# Altium project RheoBoard_v2.PrjPcb (part 1 of 5)
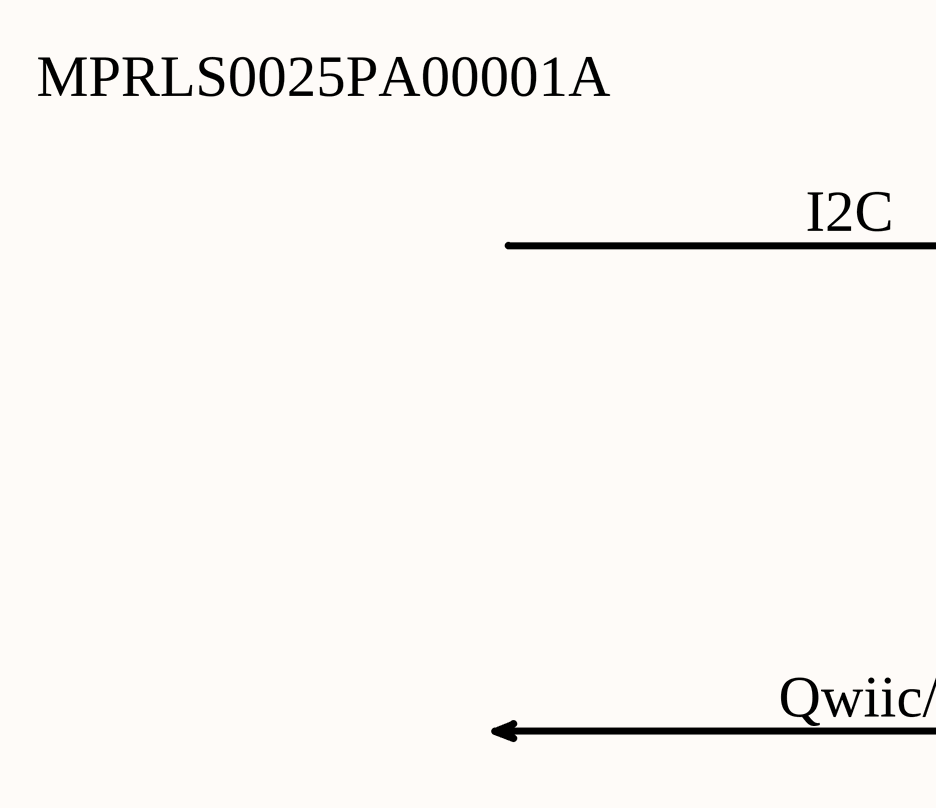
[diagram p0: RheoBoard_v2.SchDoc, top left]
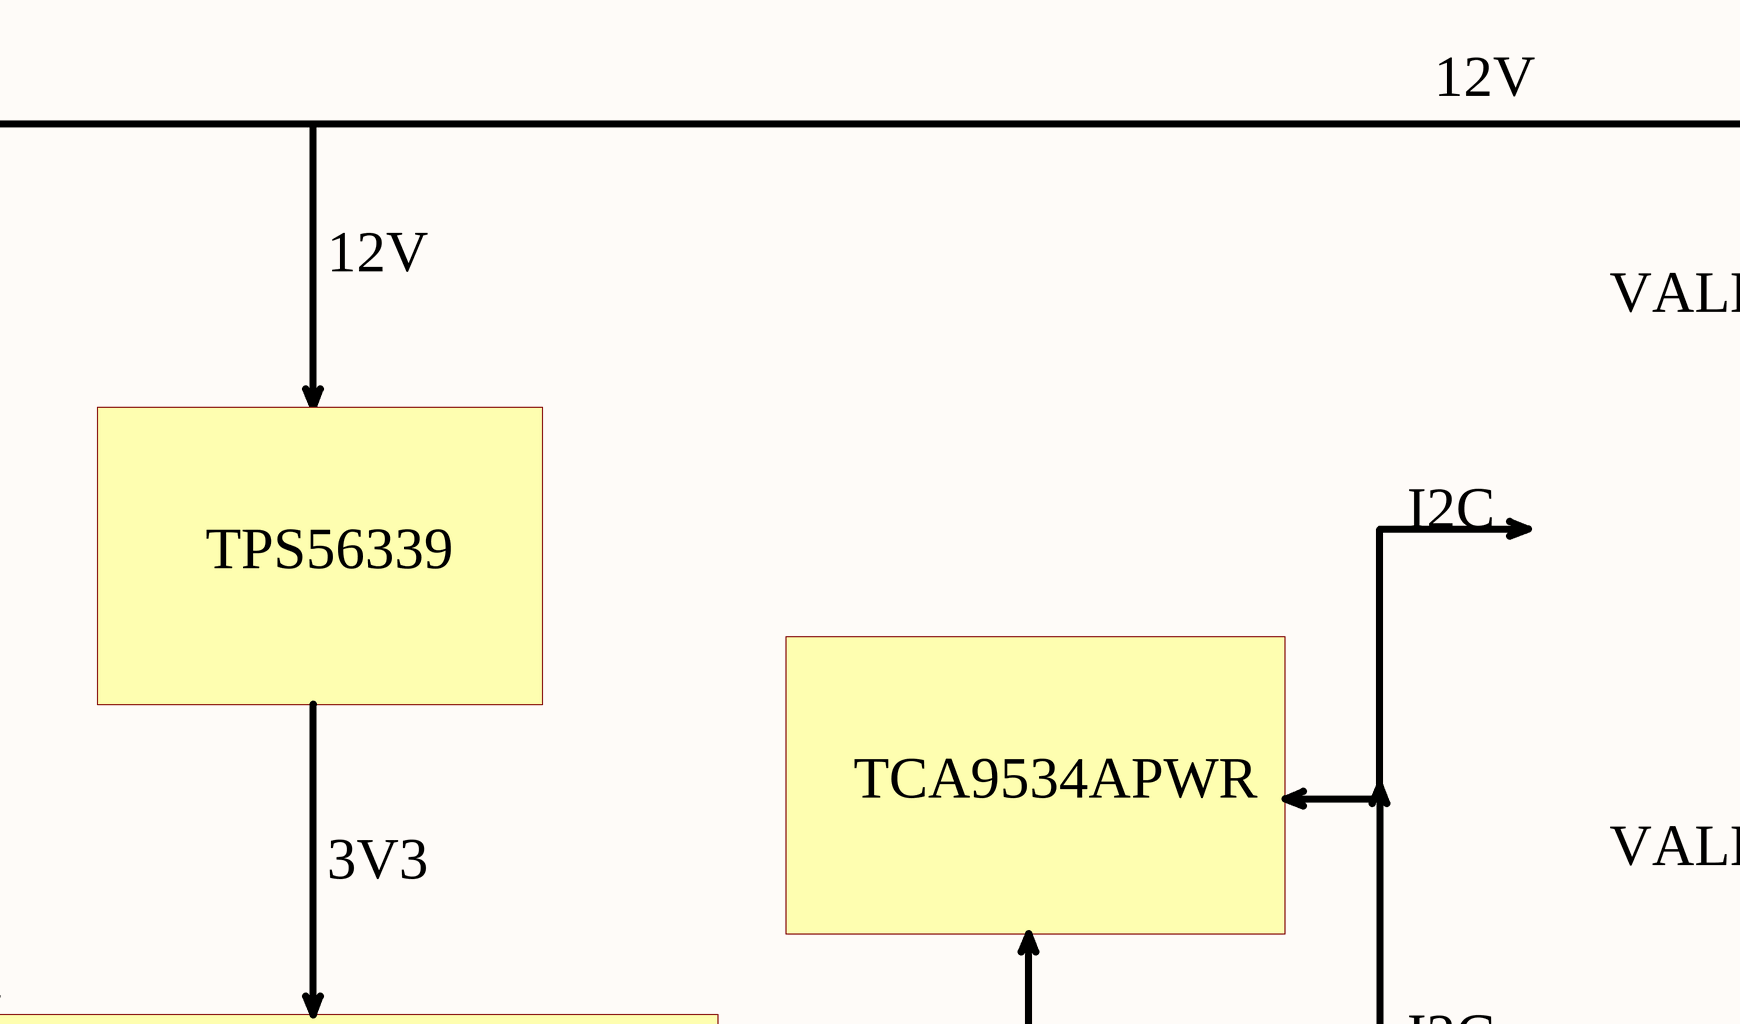
[diagram p1: RheoBoard_v2.SchDoc, top middle]
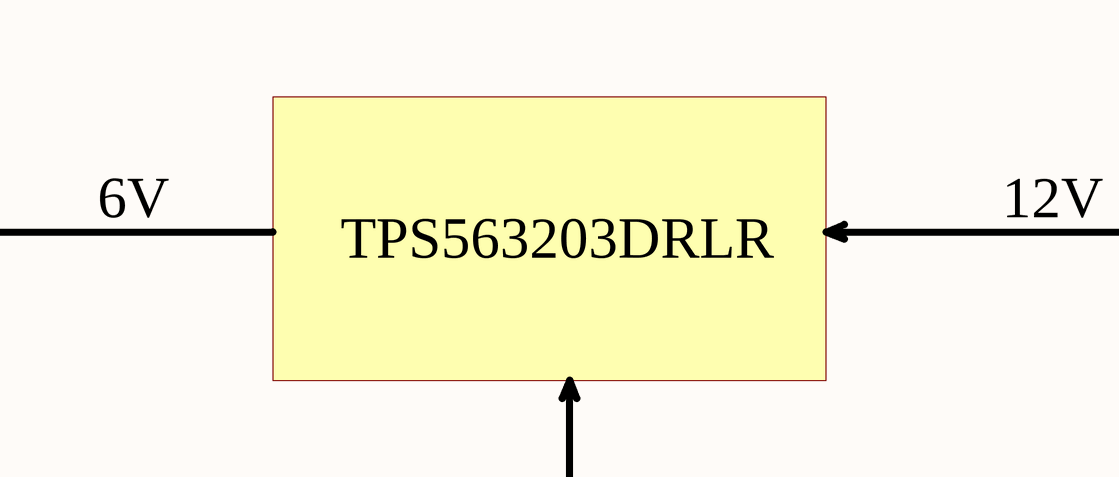
[diagram p2: RheoBoard_v2.SchDoc, top right]
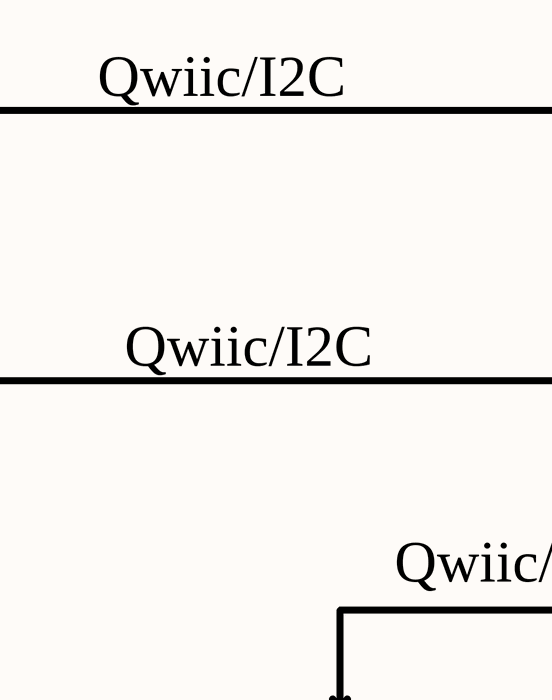
[diagram p3: RheoBoard_v2.SchDoc, bottom left]
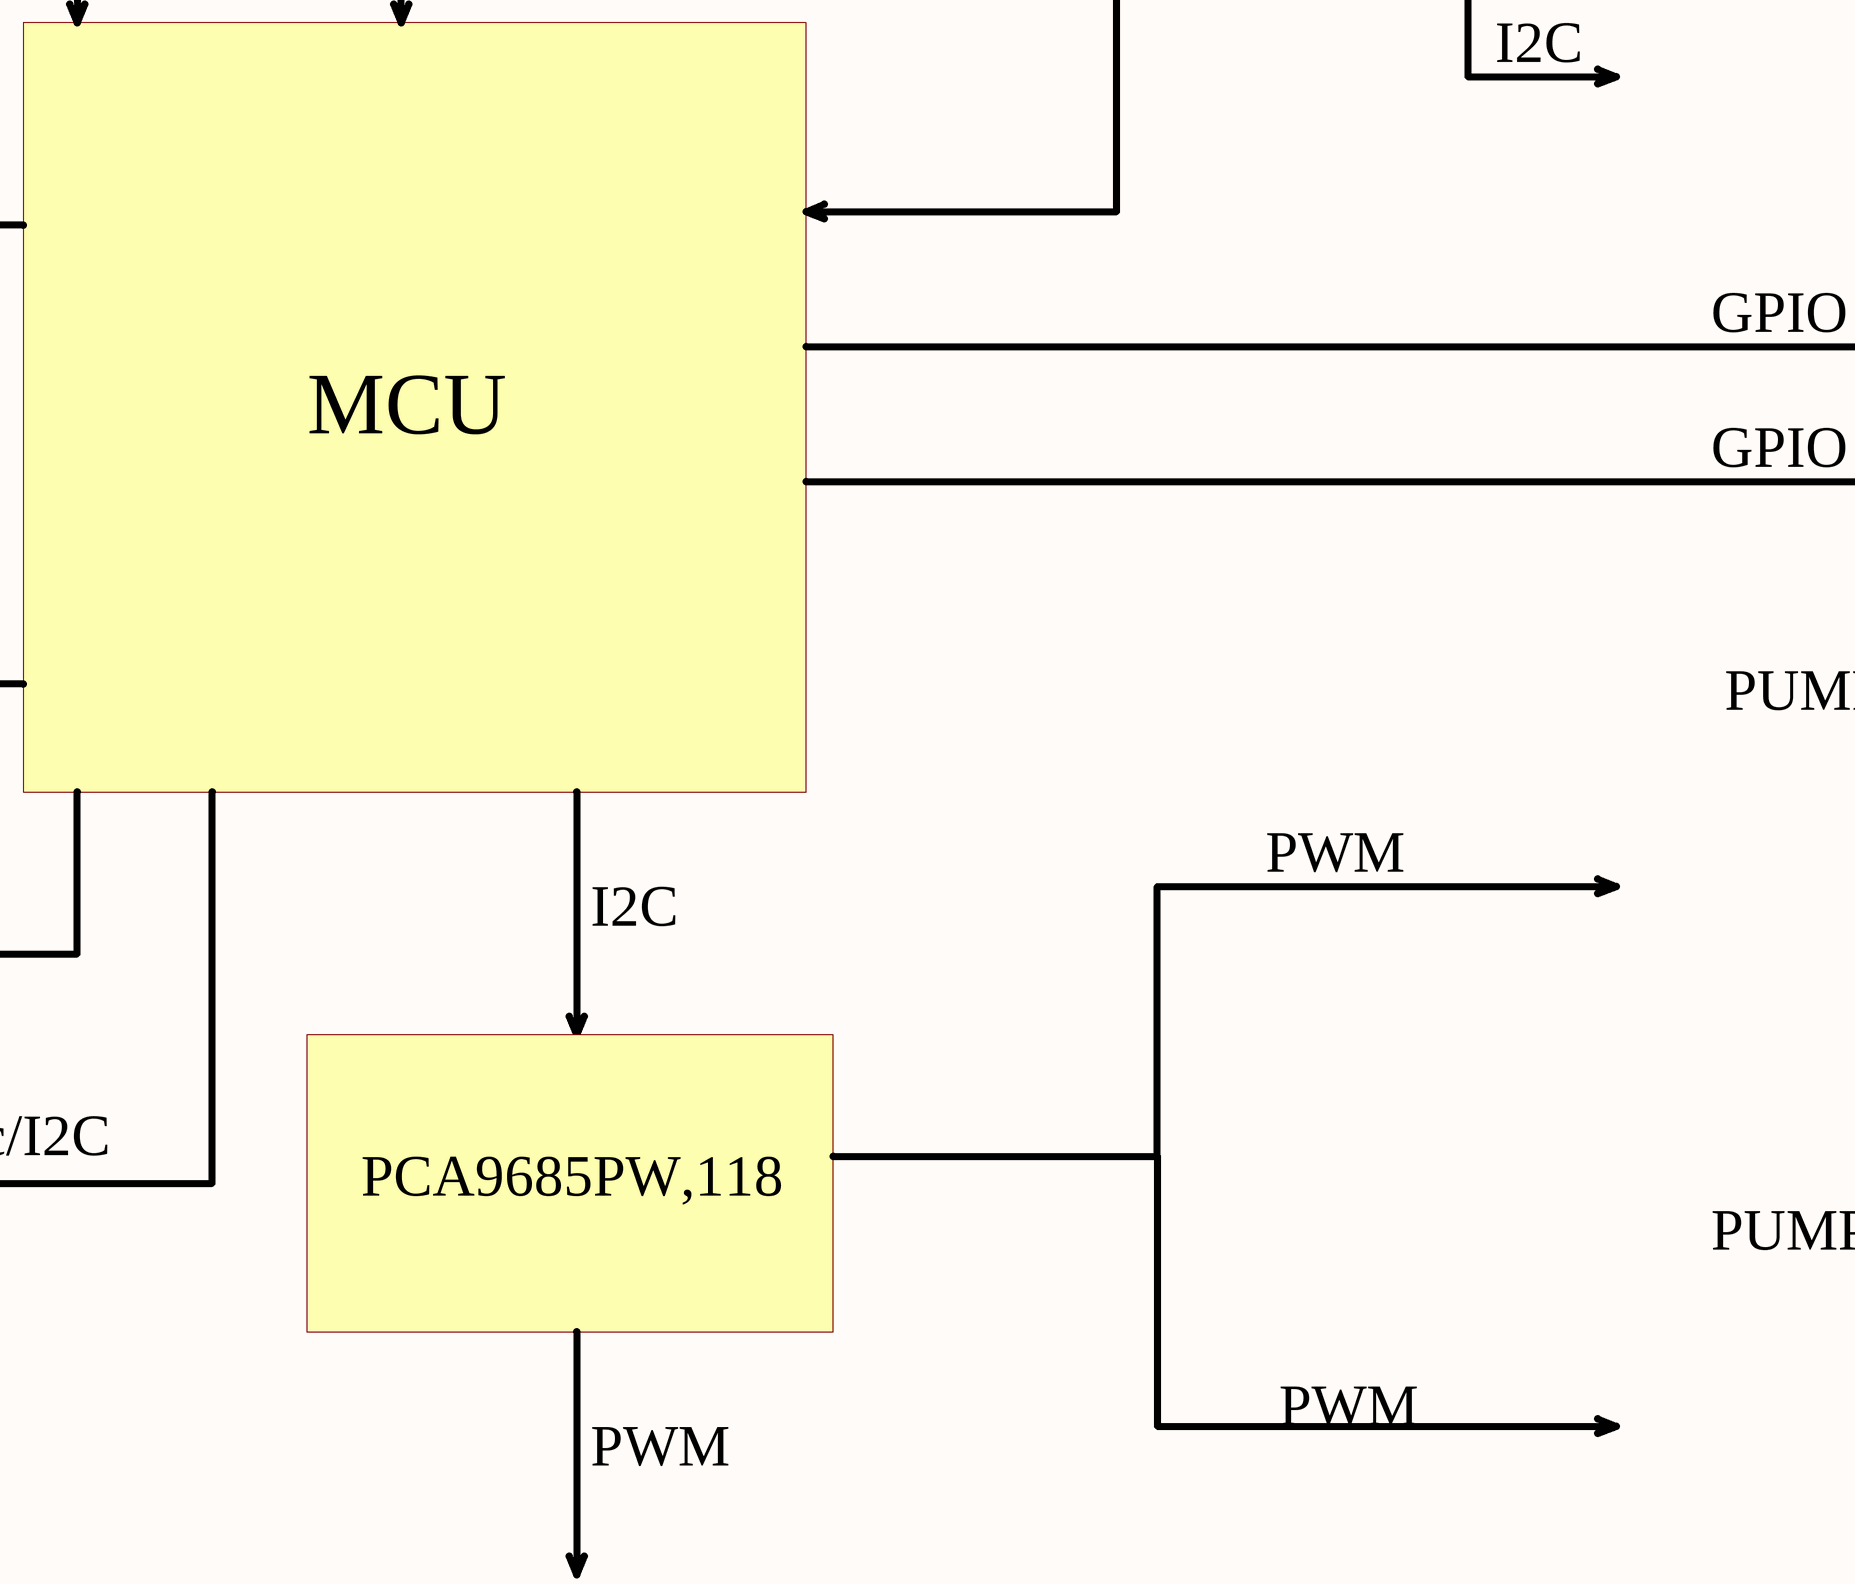
[diagram p4: RheoBoard_v2.SchDoc, bottom middle]
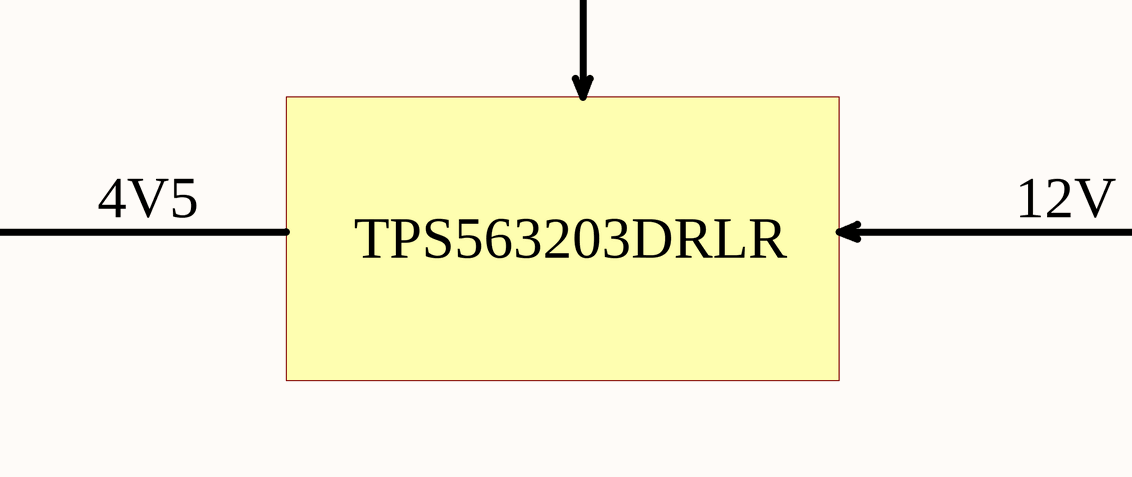
[diagram p5: RheoBoard_v2.SchDoc, bottom right]
3 sheets, 135 parts. Net scope: flat (ports and power ports of the same name join across sheets).
Board file: RheoBoard_v2.PcbDoc
Sheets:
  RheoBoard_v2.SchDoc
  MAIN.SchDoc
  POWER.SchDoc

## Sheet RheoBoard_v2.SchDoc
size A0; SheetNumber: 1; SheetTotal: 3

### Notes on the sheet
- 12V
- VALE1
- I2C
- MPRLS0025PA00001A
- TPS56339
- TCA9534APWR
- 6V
- 3V3
- VALE2
- TPS563203DRLR
- Qwiic/I2C
- GPIO
- MCU
- PUMP1
- PWM
- 4V5
- PCA9685PW,118
- PUMP2

## Sheet MAIN.SchDoc
size A1; SheetNumber: 2; SheetTotal: 3
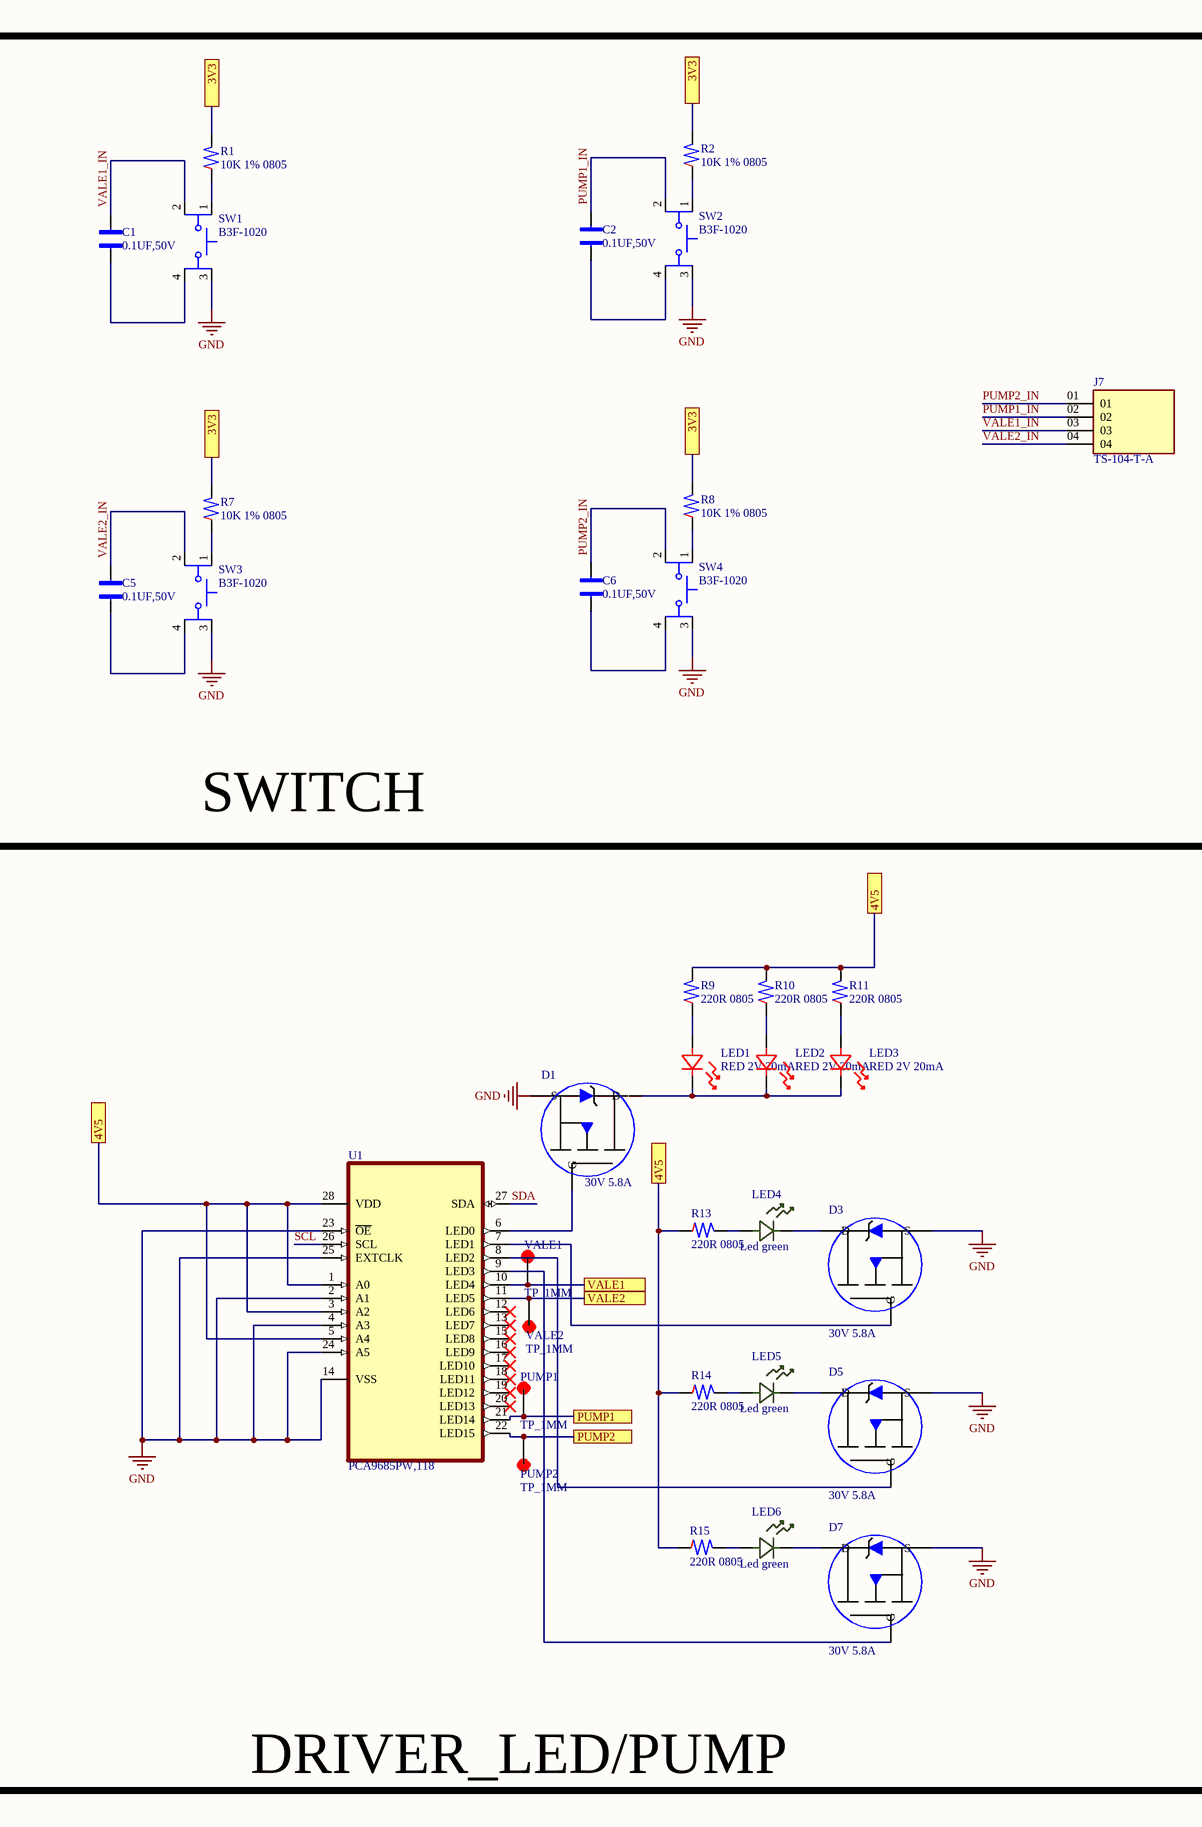
[diagram p6: MAIN.SchDoc, left]
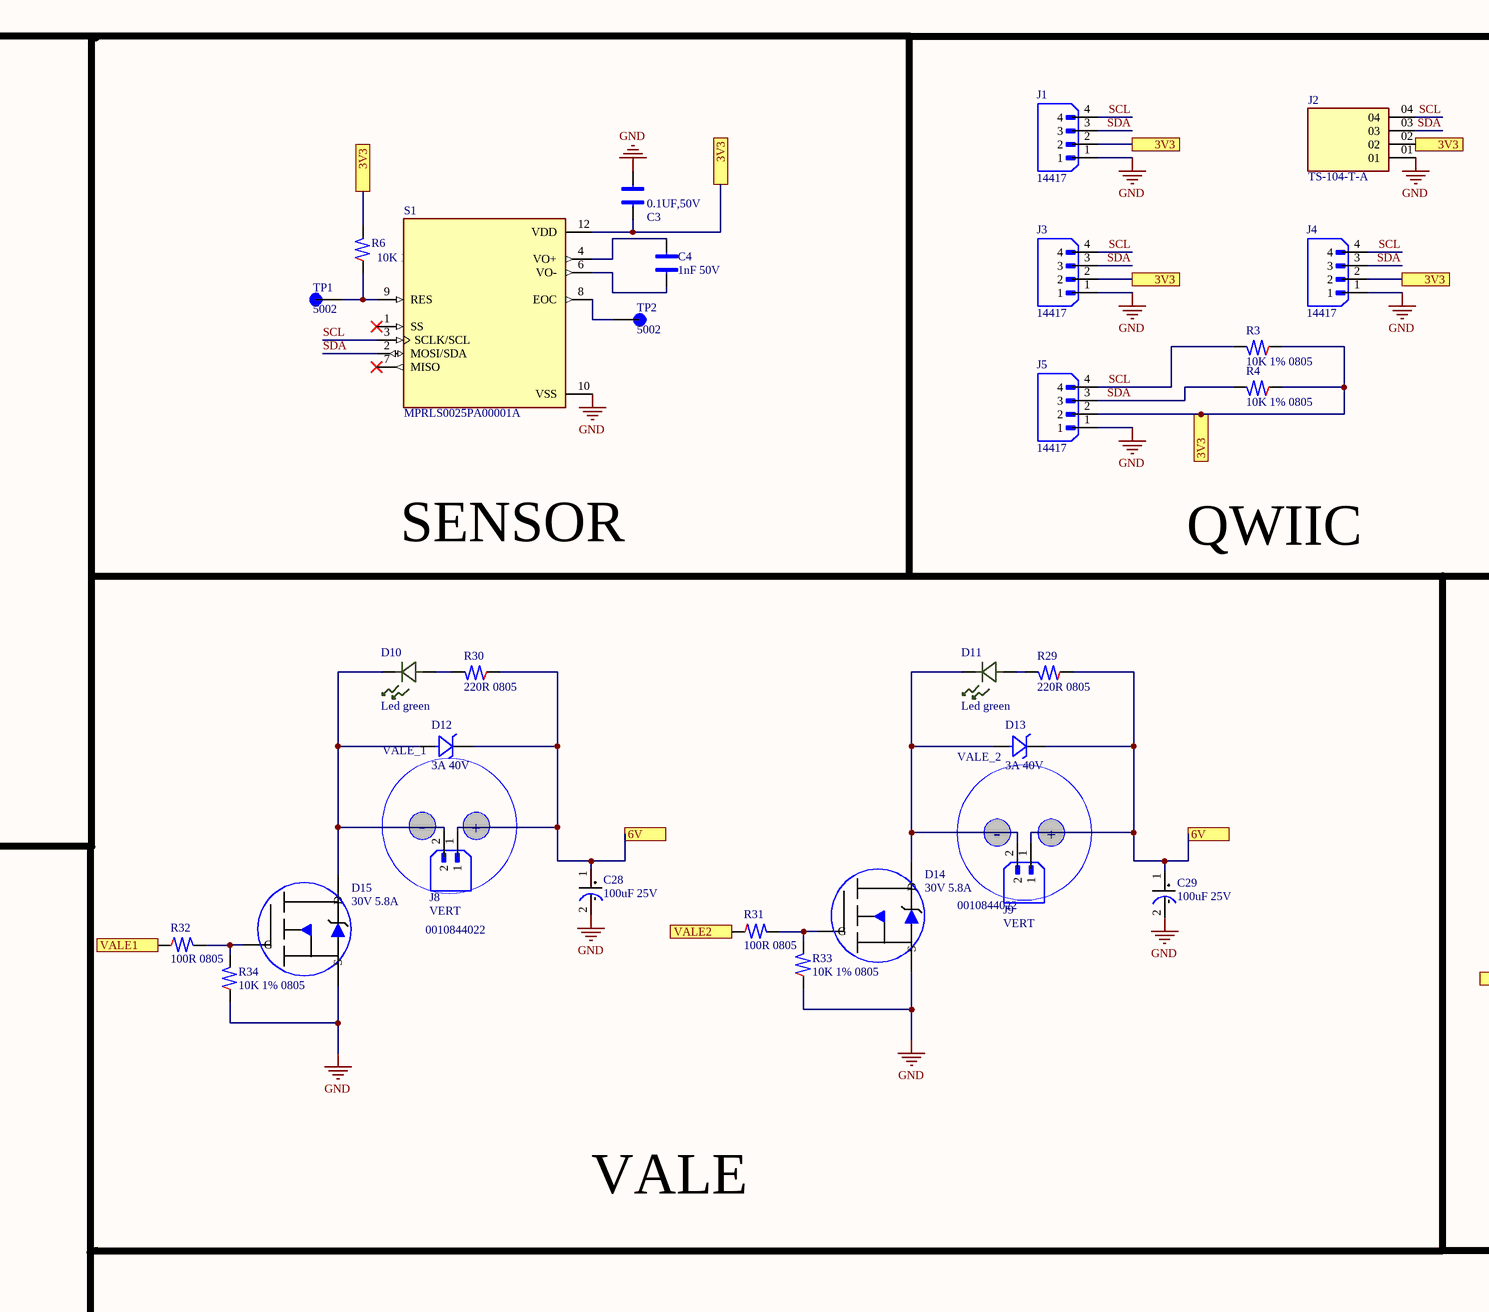
[diagram p7: MAIN.SchDoc, middle]
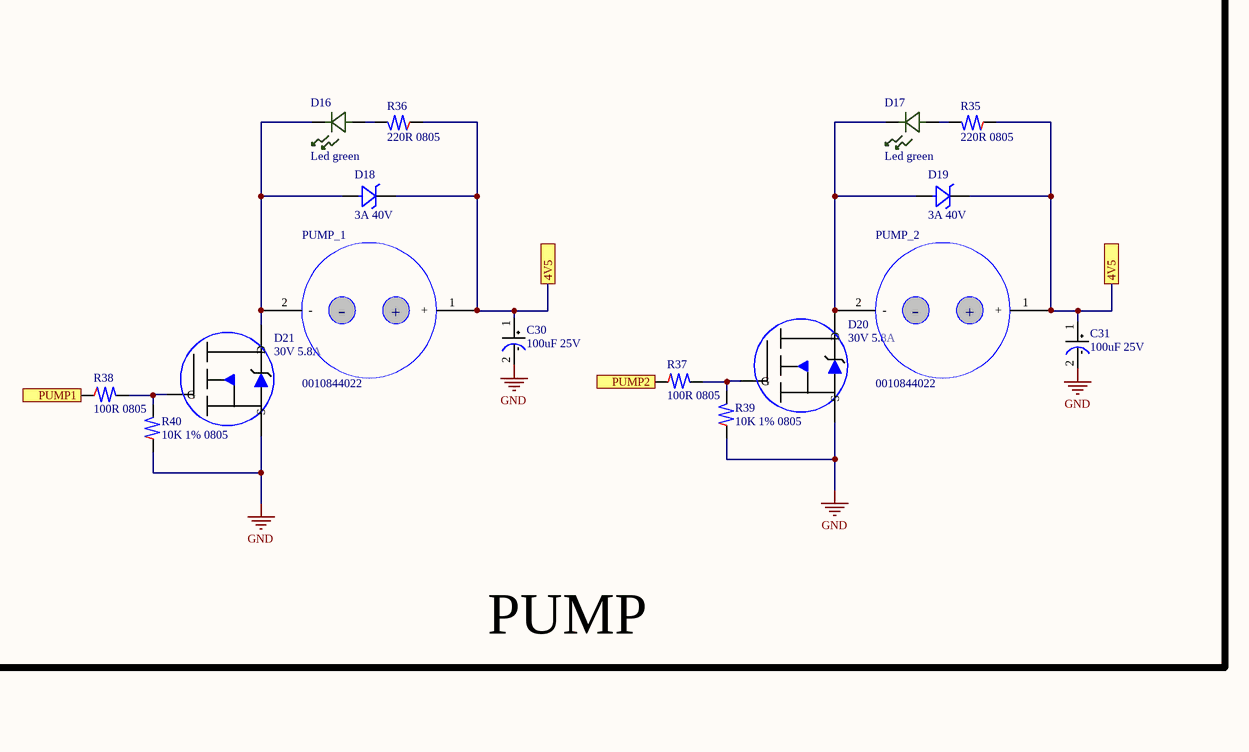
[diagram p8: MAIN.SchDoc, right]

### Parts
C1  0.1UF,50V  [CAP_CER_0805]
C2  0.1UF,50V  [CAP_CER_0805]
C3  0.1UF,50V  [CAP_CER_0805]
C4  1nF 50V  [CAP_CER_0805]
C5  0.1UF,50V  [CAP_CER_0805]
C6  0.1UF,50V  [CAP_CER_0805]
C28  100uF 25V  [CAP_ALUM_SMD_D10_H12.4]
C29  100uF 25V  [CAP_ALUM_SMD_D10_H12.4]
C30  100uF 25V  [CAP_ALUM_SMD_D10_H12.4]
C31  100uF 25V  [CAP_ALUM_SMD_D10_H12.4]
D1  30V 5.8A  [SOT-23-3]
D3  30V 5.8A  [SOT-23-3]
D5  30V 5.8A  [SOT-23-3]
D7  30V 5.8A  [SOT-23-3]
D10  Led green  [LED_LS R976_AOS]
D11  Led green  [LED_LS R976_AOS]
D12  3A 40V  [DO214AA]
D13  3A 40V  [DO214AA]
D14  30V 5.8A  [SOT-23-3]
D15  30V 5.8A  [SOT-23-3]
D16  Led green  [LED_LS R976_AOS]
D17  Led green  [LED_LS R976_AOS]
D18  3A 40V  [DO214AA]
D19  3A 40V  [DO214AA]
D20  30V 5.8A  [SOT-23-3]
D21  30V 5.8A  [SOT-23-3]
J1  14417  [SPARKFUN_PRT-14417]
J2  TS-104-T-A  [HDR_THT_1x04_P2.54]
J3  14417  [SPARKFUN_PRT-14417]
J4  14417  [SPARKFUN_PRT-14417]
J5  14417  [SPARKFUN_PRT-14417]
J7  TS-104-T-A  [HDR_THT_1x04_P2.54]
J8  VERT  [CONN_SMD_TOP_P2.50]
J9  VERT  [CONN_SMD_TOP_P2.50]
LED1  RED 2V 20mA  [LED_LS R976_AOS]
LED2  RED 2V 20mA  [LED_LS R976_AOS]
LED3  RED 2V 20mA  [LED_LS R976_AOS]
LED4  Led green  [LED_LS R976_AOS]
LED5  Led green  [LED_LS R976_AOS]
LED6  Led green  [LED_LS R976_AOS]
PUMP1  TP_1MM  [TP_1mm]
PUMP2  TP_1MM  [TP_1mm]
PUMP_1  0010844022  [PUMP_LPM - ZR370-02PM]
PUMP_2  0010844022  [PUMP_LPM - ZR370-02PM]
R1  10K 1% 0805  [RES_0805]
R2  10K 1% 0805  [RES_0805]
R3  10K 1% 0805  [RES_0805]
R4  10K 1% 0805  [RES_0805]
R6  10K 1% 0805  [RES_0805]
R7  10K 1% 0805  [RES_0805]
R8  10K 1% 0805  [RES_0805]
R9  220R 0805  [RES_0805]
R10  220R 0805  [RES_0805]
R11  220R 0805  [RES_0805]
R13  220R 0805  [RES_0805]
R14  220R 0805  [RES_0805]
R15  220R 0805  [RES_0805]
R29  220R 0805  [RES_0805]
R30  220R 0805  [RES_0805]
R31  100R 0805  [RES_0805]
R32  100R 0805  [RES_0805]
R33  10K 1% 0805  [RES_0805]
R34  10K 1% 0805  [RES_0805]
R35  220R 0805  [RES_0805]
R36  220R 0805  [RES_0805]
R37  100R 0805  [RES_0805]
R38  100R 0805  [RES_0805]
R39  10K 1% 0805  [RES_0805]
R40  10K 1% 0805  [RES_0805]
S1  MPRLS0025PA00001A  [XDCR_MPRLS0025PA00001A]
SW1  B3F-1020  [SW_B3F-1000_OMR]
SW2  B3F-1020  [SW_B3F-1000_OMR]
SW3  B3F-1020  [SW_B3F-1000_OMR]
SW4  B3F-1020  [SW_B3F-1000_OMR]
TP1  5002  [KEYSTONE_5002]
TP2  5002  [KEYSTONE_5002]
U1  PCA9685PW,118  [TSSOP-28]
VALE1  TP_1MM  [TP_1mm]
VALE2  TP_1MM  [TP_1mm]
VALE_1  0010844022  [VALE_FA0520E]
VALE_2  0010844022  [VALE_FA0520E]

### Ports
3V3, 4V5, 6V, PUMP1, PUMP2, VALE1, VALE2

### Nets
GND: C3.2 C28.2 C29.2 C30.2 C31.2 D1.2(S) D3.2(S) D5.2(S) D7.2(S) D14.2(S) D15.2(S) D20.2(S) D21.2(S) J1.1 J2.01 J3.1 J4.1 J5.1 R33.1 R34.1 R39.1 R40.1 S1.10(VSS) SW1.3 SW2.3 SW3.3 SW4.3 U1.2(A1) U1.4(A3) U1.14(VSS) U1.23(~{OE}) U1.24(A5) U1.25(EXTCLK)
PUMP1_IN: C2.2 J7.02 SW2.2
PUMP2_IN: C6.2 J7.01 SW4.2
SCL: J1.4 J2.04 J3.4 J4.4 J5.4 R3.2 S1.3(SCLK/SCL) U1.26(SCL)
SDA: J1.3 J2.03 J3.3 J4.3 J5.3 R4.2 S1.2(MOSI/SDA) U1.27(SDA)
VALE1_IN: C1.2 J7.03 SW1.2
VALE2_IN: C5.2 J7.04 SW3.2
Net3V3_1: C3.1 J1.2 J2.02 J3.2 J4.2 J5.2 R1.2 R2.2 R3.1 R4.1 R6.2 R7.2 R8.2 S1.12(VDD) ; port 3V3
Net4V5_1: C30.1 C31.1 D18.1(CATHODE) D19.1(CATHODE) PUMP_1.1(+) PUMP_2.1(+) R9.2 R10.2 R11.2 R13.1 R14.1 R15.1 R35.1 R36.1 U1.1(A0) U1.3(A2) U1.5(A4) U1.28(VDD) ; port 4V5
Net6V_1: C28.1 C29.1 D12.1(CATHODE) D13.1(CATHODE) J8.1 J9.1 R29.1 R30.1 ; port 6V
NetC1_1: C1.1 SW1.4
NetC2_1: C2.1 SW2.4
NetC4_1: C4.1 S1.6(VO-)
NetC4_2: C4.2 S1.4(VO+)
NetC5_1: C5.1 SW3.4
NetC6_1: C6.1 SW4.4
NetD1_1: D1.1(G) U1.6(LED0)
NetD1_3: D1.3(D) LED1.1 LED2.1 LED3.1
NetD3_1: D3.1(G) U1.7(LED1)
NetD3_3: D3.3(D) LED4.1
NetD5_1: D5.1(G) U1.8(LED2)
NetD5_3: D5.3(D) LED5.1
NetD7_1: D7.1(G) U1.9(LED3)
NetD7_3: D7.3(D) LED6.1
NetD10_1: D10.1 D12.2(ANODE) D15.3(D) J8.2
NetD10_2: D10.2 R30.2
NetD11_1: D11.1 D13.2(ANODE) D14.3(D) J9.2
NetD11_2: D11.2 R29.2
NetD14_1: D14.1(G) R31.2 R33.2
NetD15_1: D15.1(G) R32.2 R34.2
NetD16_1: D16.1 D18.2(ANODE) D21.3(D) PUMP_1.2(-)
NetD16_2: D16.2 R36.2
NetD17_1: D17.1 D19.2(ANODE) D20.3(D) PUMP_2.2(-)
NetD17_2: D17.2 R35.2
NetD20_1: D20.1(G) R37.2 R39.2
NetD21_1: D21.1(G) R38.2 R40.2
NetLED1_2: LED1.2 R9.1
NetLED2_2: LED2.2 R10.1
NetLED3_2: LED3.2 R11.1
NetLED4_2: LED4.2 R13.2
NetLED5_2: LED5.2 R14.2
NetLED6_2: LED6.2 R15.2
NetPUMP1_1: PUMP1.1 R38.1 U1.21(LED14) ; port PUMP1
NetPUMP2_1: PUMP2.1 R37.1 U1.22(LED15) ; port PUMP2
NetR1_1: R1.1 SW1.1
NetR2_1: R2.1 SW2.1
NetR6_1: R6.1 S1.9(RES) TP1.TP
NetR7_1: R7.1 SW3.1
NetR8_1: R8.1 SW4.1
NetR31_1: R31.1 U1.11(LED5) VALE2.1 ; port VALE2
NetR32_1: R32.1 U1.10(LED4) VALE1.1 ; port VALE1
NetS1_8: S1.8(EOC) TP2.TP

Not connected (* = marked no-connect by the designer): S1 1(SS)* 7(MISO)*; U1 12(LED6)* 13(LED7)* 15(LED8)* 16(LED9)* 17(LED10)* 18(LED11)* 19(LED12)* 20(LED13)*

### Notes on the sheet
- SENSOR
- QWIIC
- SWITCH
- VALE
- PUMP
- DRIVER_LED/PUMP
- (in symbol 6V Air Valve with 2-pin JST XH Connector - FA0520E) -; +